# Altium schematic sheet frontend_tx.SchDoc: Наименование
size 420 x 297 mm; ApprovedBy: Утвердил; CheckedBy: Проверил; Author: Разработал; CompanyName: ВлГУ; DrawnBy: Н.Контр; Engineer: Т.Контр; SheetNumber: 7; SheetTotal: 9; PageSetup: Record=PageOptions|CenterHorizontal=True|CenterVertical=True|PrintScale=0.94|XCorrection=1.00|YCorrection=1.00|PrintKind=1|BorderSize=5000000|LeftOffset=0|BottomOffset=0|Orientation=1|PaperLength=1000|PaperWidth=1000|Scale=100|PaperSource=7|PrintQuality=-4|MediaType=1|DitherType=10|PaperKind=A4|PrintScaleMode=1; DecimalNumber: Децимальный номер; HeadOfSector: Нач. сектора; MainDevice: Перв.примен.; Name: Наименование; DocumentName: Sheet1.SCHDOC
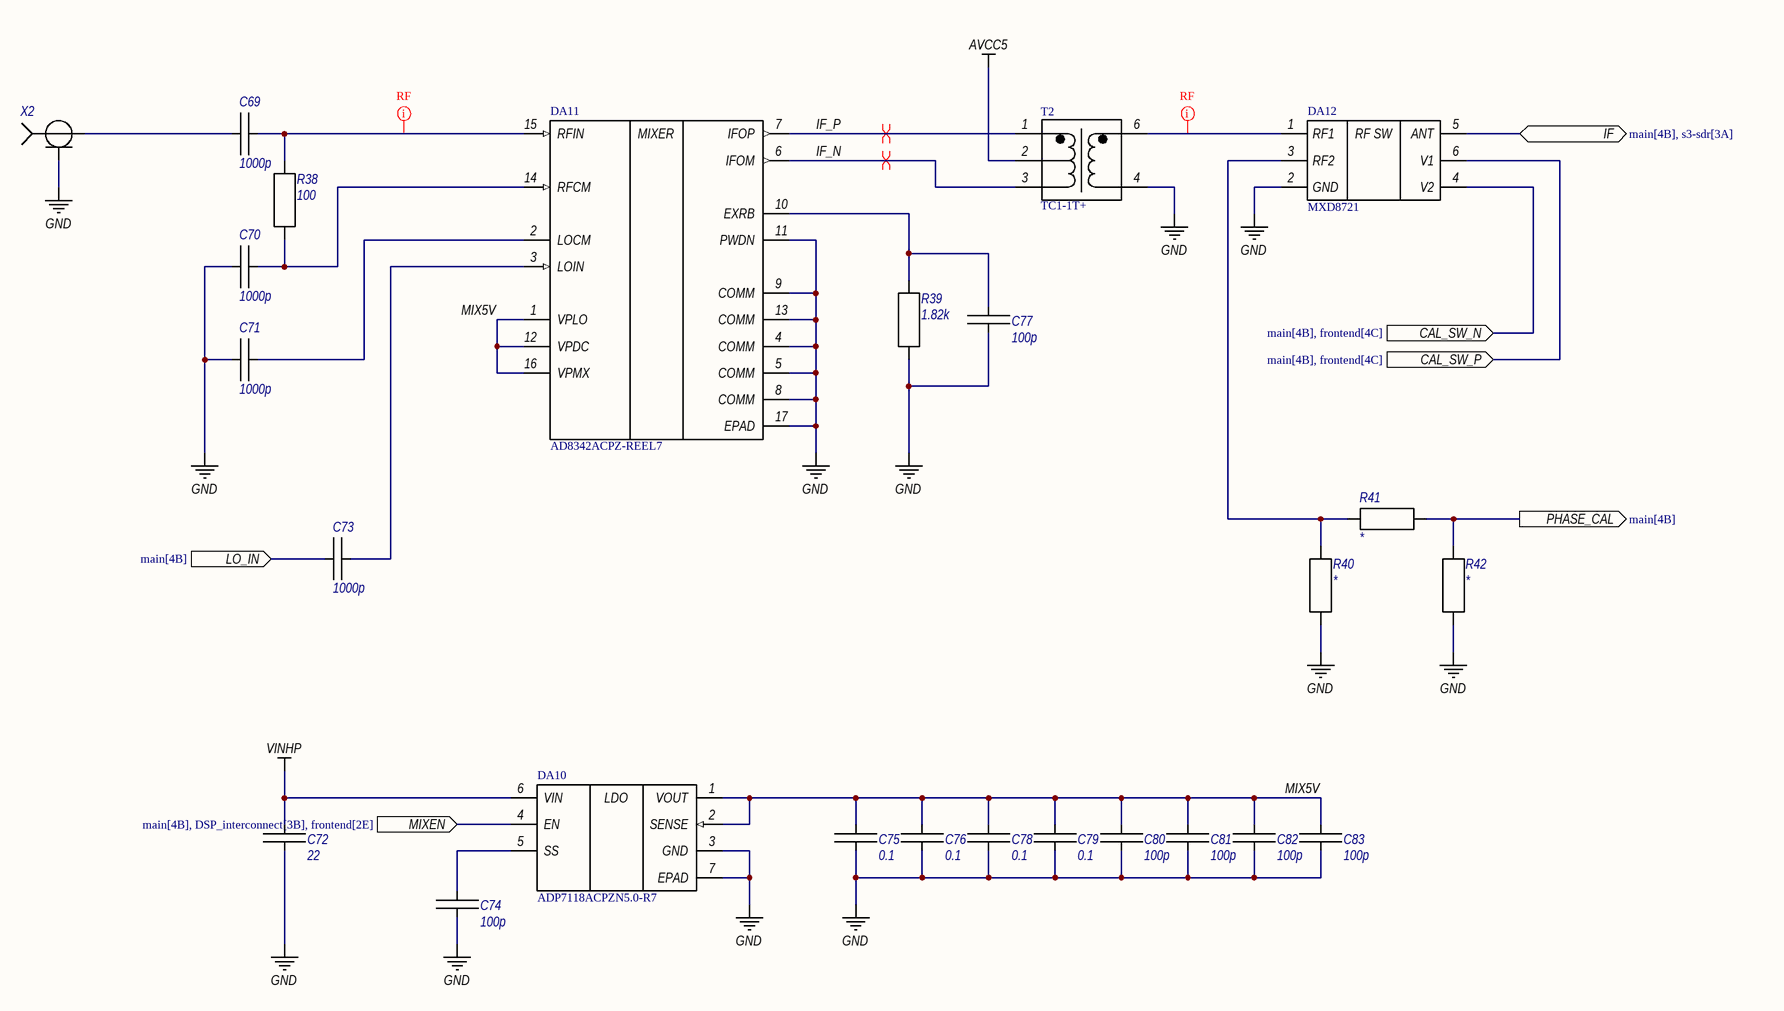
[diagram p0: frontend_tx.SchDoc]

## Parts
C69  1000p  [C0402C]
C70  1000p  [C0402C]
C71  1000p  [C0402C]
C72  22  [C0805C]
C73  1000p  [C0402C]
C74  100p  [C0603C]
C75  0.1  [C0805C]
C76  0.1  [C0805C]
C77  100p  [C0603C]
C78  0.1  [C0805C]
C79  0.1  [C0805C]
C80  100p  [C0603C]
C81  100p  [C0603C]
C82  100p  [C0603C]
C83  100p  [C0603C]
DA10  ADP7118ACPZN5.0-R7  [CP-6-3_ADI]
DA11  AD8342ACPZ-REEL7  [CP_16_27_ADI-M]
DA12  MXD8721  [SON35P100X50-6N]
R38  100  [C0603R]
R39  1.82k  [C0603R]
R40  *  [C0402R]
R41  *  [C0402R]
R42  *  [C0402R]
T2  TC1-1T+  [AT224-1A_MNC]
X2  (no value)  [IPEX PAD]

## Ports
CAL_SW_N (in, see main[4B], frontend[4C]), CAL_SW_P (in, see main[4B], frontend[4C]), IF (bidir, see main[4B], s3-sdr[3A]), LO_IN (in, see main[4B]), MIXEN (in, see main[4B], DSP_interconnect[3B], frontend[2E]), PHASE_CAL (out, see main[4B])

## Nets
AVCC5: T2.2(SCONDARY_CT)
GND: C70.1 C71.1 C72.2 C74.2 C75.2 C76.2 C77.2 C78.2 C79.2 C80.2 C81.2 C82.2 C83.2 DA10.3(GND) DA10.7(EPAD) DA11.4(COMM) DA11.5(COMM) DA11.8(COMM) DA11.9(COMM) DA11.11(PWDN) DA11.13(COMM) DA11.17(EPAD) DA12.2(GND) R39.2 R40.2 R42.2 T2.4(PRIMARY) X2.2
VINHP: C72.1 DA10.6(VIN)
CAL_SW_N: DA12.4(V2) ; port CAL_SW_N
CAL_SW_P: DA12.6(V1) ; port CAL_SW_P
IF: DA12.5(ANT) ; port IF
IF_N: DA11.6(IFOM) T2.3(SECONDARY)
IF_P: DA11.7(IFOP) T2.1(SECONDARY_DOT)
LO_IN: C73.1 ; port LO_IN
MIX5V: C75.1 C76.1 C78.1 C79.1 C80.1 C81.1 C82.1 C83.1 DA10.1(VOUT) DA10.2(SENSE) DA11.1(VPLO) DA11.12(VPDC) DA11.16(VPMX)
MIXEN: DA10.4(EN) ; port MIXEN
PHASE_CAL: R41.1 R42.1 ; port PHASE_CAL
NetC69_1: C69.1 X2.1
NetC69_2: C69.2 DA11.15(RFIN) R38.1
NetC70_2: C70.2 DA11.14(RFCM) R38.2
NetC71_2: C71.2 DA11.2(LOCM)
NetC73_2: C73.2 DA11.3(LOIN)
NetC74_1: C74.1 DA10.5(SS)
NetC77_1: C77.1 DA11.10(EXRB) R39.1
NetDA12_1: DA12.1(RF1) T2.6(PRIMARY_DOT)
NetDA12_3: DA12.3(RF2) R40.1 R41.2

## Layout directives
net class RF: NetC69_2, NetDA12_1
differential pair: IF_N, IF_P

## Notes on the sheet
- Подп. и дата
- Инв.№ дубл.
- Взам.инв.№
- Подп.и дата
- Инв.№ подл.
- Изм.
- Лист
- № докум.
- Подп.
- Дата
- Формат  A3
- (in symbol AD8342ACPZ-REEL7) MIXER
- (in symbol ADP7118ACPZN5.0-R7) LDO
- (in symbol MXD8721) RF SW

## Library data of the parts
C69-C83 = Cap
  C69-C71 C73: Value: 1000p
  C72: Value: 22
  C74 C77 C80-C83: Value: 100p
  C75 C76 C78 C79: Value: 0.1
DA10 = ADP7118ACPZN5.0-R7: 20 V, 200 mA, Low Noise, CMOS LDO Linear Regulator; Manufacturer_Name: Analog Devices Inc; Copyright: Copyright (C) 2026 Ultra Librarian. All rights reserved.; Manufacturer_Part_Number: ADP7118ACPZN5.0-R7; Datasheet: https://www.analog.com/media/en/technical-documentation/data-sheets/adp7118.pdf; RefDes: RefDes; Type: Type
DA11 = AD8342ACPZ-REEL7: Active Receive Mixer LF to 3 GHz; Manufacturer_Name: Analog Devices Inc; Copyright: Copyright (C) 2025 Ultra Librarian. All rights reserved.; Manufacturer_Part_Number: AD8342ACPZ-REEL7; RefDes: RefDes; Type: Type
DA12 = MXD8721: 0.5-6.0GHz SPDT Switch; Part number: MXD8721
R38-R42 = res
  R38: Value: 100
  R39: Value: 1.82k
  R40-R42: Value: *
T2 = TC1-1T+: Description; Manufacturer_Name: Mini Circuits; Type: Balun; Copyright: Copyright (C) 2026 Ultra Librarian. All rights reserved.; Manufacturer_Part_Number: TC1-1T+; RefDes: RefDes
X2 = Ipex